# Altium schematic sheet Controller_Sheet.SchDoc
size A4; SheetNumber: 2; SheetTotal: 3
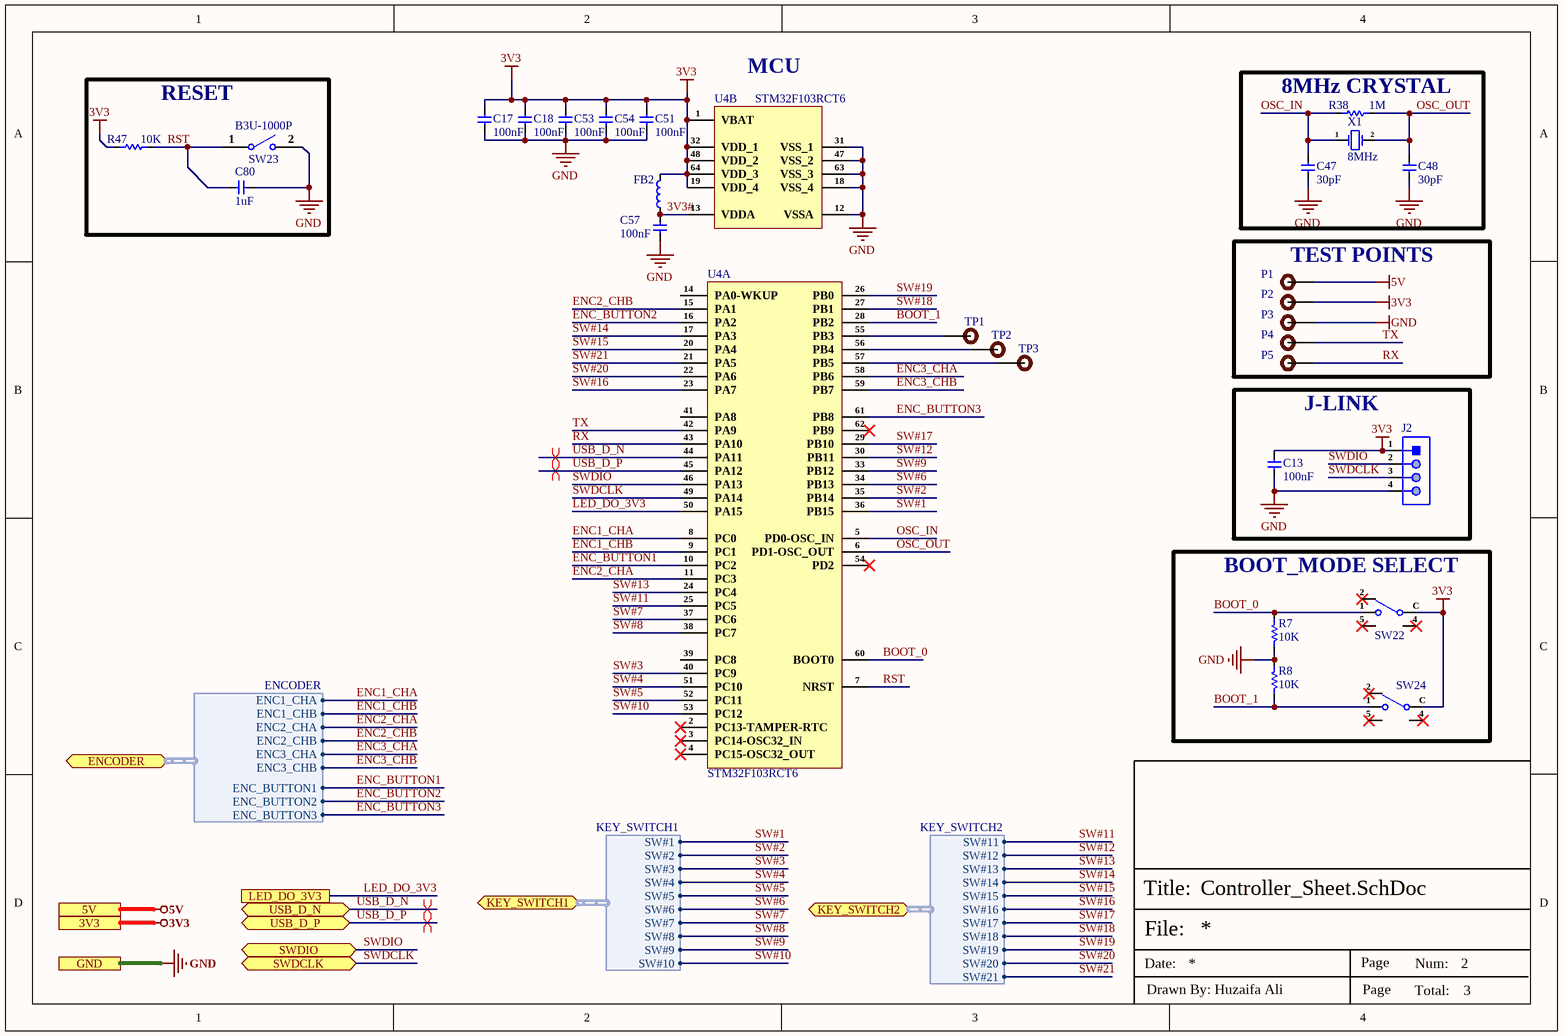
[diagram p0: Controller_Sheet.SchDoc]

## Parts
C13  100nF  [cap-0402]
C17  100nF  [cap-0402]
C18  100nF  [cap-0402]
C47  30pF  [Cap-0402]
C48  30pF  [Cap-0402]
C51  100nF  [cap-0402]
C53  100nF  [cap-0402]
C54  100nF  [cap-0402]
C57  100nF  [cap-0402]
C80  1uF  [Cap-0402]
FB2  MMZ2012R102ATD25  [Ind-0805]  (value not drawn)
J2  X6511WV-04H-C60D30  [HDR1X4_]  (value not drawn)
P1  TEST POINT  [Test-point]  (value not drawn)
P2  TEST POINT  [Test-point]  (value not drawn)
P3  TEST POINT  [Test-point]  (value not drawn)
P4  TEST POINT  [Test-point]  (value not drawn)
P5  TEST POINT  [Test-point]  (value not drawn)
R7  10K  [Res-0402]
R8  10K  [Res-0402]
R38  1M  [Res-0402]
R47  10K  [Res-0603]
SW22  MK-11C04-G013  [MK-11C04-G013]  (value not drawn)
SW23  B3U-1000P  [B3U-1000P]
SW24  MK-11C04-G013  [MK-11C04-G013]  (value not drawn)
TP1  TEST POINT 0.5mm Dia  [Test-point - 0.5mm]  (value not drawn)  (no BOM)
TP2  TEST POINT 0.5mm Dia  [Test-point - 0.5mm]  (value not drawn)  (no BOM)
TP3  TEST POINT 0.5mm Dia  [Test-point - 0.5mm]  (value not drawn)  (no BOM)
U4  STM32F103RCT6  [64-LQFP (10x10)]  (parts A,B of 2)
X1  8MHz  [0153G2-8.000F20DTNJL]

## Blocks framed on the sheet
RESET: C80 R47 SW23
8MHz CRYSTAL: C47 C48 R38 X1
TEST POINTS: P1-P5
J-LINK: C13 J2
BOOT_MODE SELECT: R7 R8 SW22 SW24

## Ports
3V3, 5V, ENCODER (bidir, harness ENCODER), GND, KEY_SWITCH1 (bidir, harness KEY_SWITCH1), KEY_SWITCH2 (bidir, harness KEY_SWITCH2), LED_DO_3V3, SWDCLK (bidir), SWDIO (bidir), USB_D_N (bidir), USB_D_P (bidir)

## Harnesses
KEY_SWITCH2: SW#11, SW#12, SW#13, SW#14, SW#15, SW#16, SW#17, SW#18, SW#19, SW#20, SW#21
KEY_SWITCH1: SW#1, SW#2, SW#3, SW#4, SW#5, SW#6, SW#7, SW#8, SW#9, SW#10
ENCODER: ENC1_CHA, ENC1_CHB, ENC2_CHA, ENC2_CHB, ENC3_CHA, ENC3_CHB, ENC_BUTTON1, ENC_BUTTON2, ENC_BUTTON3

## Nets
3V3: C13.2 C17.1 C18.1 C51.1 C53.1 C54.1 FB2.2 J2.1 P2.1 R47.1 SW22.C SW24.C U4.1(VBAT) U4.19(VDD_4) U4.32(VDD_1) U4.48(VDD_2) U4.64(VDD_3) ; port 3V3
5V: P1.1 ; port 5V
GND: C13.1 C17.2 C18.2 C47.1 C48.1 C51.2 C53.2 C54.2 C57.2 C80.2 J2.4 P3.1 R7.2 R8.1 SW23.2 U4.12(VSSA) U4.18(VSS_4) U4.31(VSS_1) U4.47(VSS_2) U4.63(VSS_3) ; port GND
3V3#: C57.1 FB2.1 U4.13(VDDA)
BOOT_0: R7.1 SW22.1 U4.60(BOOT0)
BOOT_1: R8.2 SW24.1 U4.28(PB2)
ENC1_CHA: U4.8(PC0) ; port ENCODER.ENC1_CHA
ENC1_CHB: U4.9(PC1) ; port ENCODER.ENC1_CHB
ENC2_CHA: U4.11(PC3) ; port ENCODER.ENC2_CHA
ENC2_CHB: U4.15(PA1) ; port ENCODER.ENC2_CHB
ENC3_CHA: U4.58(PB6) ; port ENCODER.ENC3_CHA
ENC3_CHB: U4.59(PB7) ; port ENCODER.ENC3_CHB
ENC_BUTTON1: U4.10(PC2) ; port ENCODER.ENC_BUTTON1
ENC_BUTTON2: U4.16(PA2) ; port ENCODER.ENC_BUTTON2
ENC_BUTTON3: U4.61(PB8) ; port ENCODER.ENC_BUTTON3
LED_DO_3V3: U4.50(PA15) ; port LED_DO_3V3
OSC_IN: C47.2 R38.1 U4.5(PD0-OSC_IN) X1.1(OSC1)
OSC_OUT: C48.2 R38.2 U4.6(PD1-OSC_OUT) X1.2(OSC2)
RST: C80.1 R47.2 SW23.1 U4.7(NRST)
RX: P5.1 U4.43(PA10)
SW#1: U4.36(PB15) ; port KEY_SWITCH1.SW#1
SW#2: U4.35(PB14) ; port KEY_SWITCH1.SW#2
SW#3: U4.40(PC9) ; port KEY_SWITCH1.SW#3
SW#4: U4.51(PC10) ; port KEY_SWITCH1.SW#4
SW#5: U4.52(PC11) ; port KEY_SWITCH1.SW#5
SW#6: U4.34(PB13) ; port KEY_SWITCH1.SW#6
SW#7: U4.37(PC6) ; port KEY_SWITCH1.SW#7
SW#8: U4.38(PC7) ; port KEY_SWITCH1.SW#8
SW#9: U4.33(PB12) ; port KEY_SWITCH1.SW#9
SW#10: U4.53(PC12) ; port KEY_SWITCH1.SW#10
SW#11: U4.25(PC5) ; port KEY_SWITCH2.SW#11
SW#12: U4.30(PB11) ; port KEY_SWITCH2.SW#12
SW#13: U4.24(PC4) ; port KEY_SWITCH2.SW#13
SW#14: U4.17(PA3) ; port KEY_SWITCH2.SW#14
SW#15: U4.20(PA4) ; port KEY_SWITCH2.SW#15
SW#16: U4.23(PA7) ; port KEY_SWITCH2.SW#16
SW#17: U4.29(PB10) ; port KEY_SWITCH2.SW#17
SW#18: U4.27(PB1) ; port KEY_SWITCH2.SW#18
SW#19: U4.26(PB0) ; port KEY_SWITCH2.SW#19
SW#20: U4.22(PA6) ; port KEY_SWITCH2.SW#20
SW#21: U4.21(PA5) ; port KEY_SWITCH2.SW#21
SWDCLK: J2.3 U4.49(PA14) ; port SWDCLK
SWDIO: J2.2 U4.46(PA13) ; port SWDIO
TX: P4.1 U4.42(PA9)
USB_D_N: U4.44(PA11) ; port USB_D_N
USB_D_P: U4.45(PA12) ; port USB_D_P
NetTP1_1: TP1.1 U4.55(PB3)
NetTP2_1: TP2.1 U4.56(PB4)
NetTP3_1: TP3.1 U4.57(PB5)

Not connected (* = marked no-connect by the designer): SW22 2* 4(MP)* 5(MP)*; SW24 2* 4(MP)* 5(MP)*; U4 2(PC13-TAMPER-RTC)* 3(PC14-OSC32_IN)* 4(PC15-OSC32_OUT)* 14(PA0-WKUP) 39(PC8) 41(PA8) 54(PD2)* 62(PB9)*

## Layout directives
differential pair; net class USB; differential pair class USB_Lines; rule Impedance Constraint [Min = 85.00    Max = 90.00    ]; rule Matched Net Lengths [Tolerance = 50mil]: USB_D_N, USB_D_P

## Notes on the sheet
- (near U4) MCU
- File:
- Title:
- Date:
- Page
- Num:
- Total:
- Drawn By: Huzaifa Ali

## Library data of the parts
C13 C17 C18 C51 C53 C54 C57 = C1005X7R1H104KT000F: CAP CER 0.1UF 50V X7R 0402; Manufacturer: TDK; Tolerance: 10%; Voltage: 25V; Item Type: Capacitor; Supplier 1: Avnet; Manufacturer Part Number: C1005X7R1H104KT000F; RoHS: No; Category: Ceramic Capacitors; Dielectric: X7R; Supplier Part Number 1: C1005X7R1H104KT000F; LCSC Part Number: C361198; ComponentLink1Description: LCSC; ComponentLink1URL: https://www.lcsc.com/product-detail/Multilayer-Ceramic-Capacitors-MLCC-SMD-SMT_TDK-C1005X7R1H104KT000F_C361198.html
C47 C48 = CC0402GRNPO9BN300: CAP CER 30PF 50V C0G/NPO 0402; Manufacturer: Yageo; Item Type: Capacitor; Tolerance: 2%; Dielectric: C0G; Supplier: Digikey; LCSC Part Number: C277479; Manufacturer Part Number: CC0402GRNPO9BN300; RoHS: Yes; Stock: 114930; Pricing: 1=0.1, 10=0.052, 50=0.0296, 100=0.023, 500=0.01728, 1000=0.01358, 2500=0.01235, 5000=0.01136 (USD); Mounting Technology: Surface Mount; Case/Package: 0402; Case Code (Imperial): 0402; Case Code (Metric): 1005; Weight: 2.3E-05oz; Min Operating Temperature: -55°C; Max Operating Temperature: 125°C; Value: 30pF; Voltage Rating (DC): 50V; Packaging: Tape and Reel; Termination: SMD/SMT; Voltage Rating: 50V; Series: CC; Length: 0.039inch; Width: 0.02inch; Thickness: 0.022inch; Halogen Free: 5694HalogenFree; Lead Free: 5697LeadFree; ComponentLink1URL: https://datasheet.ciiva.com/13263/upy-gp-np0-16v-to-50v-8-3714-13263350.pdf?src-supplier=Mouser; ComponentLink1Description: https://datasheet.ciiva.com/13263/upy-gp-np0-16v-to-50v-8-3714-13263350.pdf?src-supplier=Mouser
C80 = C1005X5R1V105K050BC: CAP CER 1UF 35V X5R 0402; Manufacturer: TDK; Item Type: Capacitors; Dielectric Material: Ceramic; Material: 4241ConductorMaterial; Tolerance: 10%; Supplier: Digikey; Supplier Part Number: 445-9073-1-ND; Manufacturer Part Number: C1005X5R1V105K050BC; RoHS: Yes; Stock: 682645; Pricing: 1=0.15, 10=0.087, 50=0.061, 100=0.0528, 500=0.03898, 1000=0.03468, 2500=0.03011, 5000=0.02735 (USD); Mounting Technology: Surface Mount; Case/Package: 0402; Case Code (Metric): 1005; Case Code (Imperial): 0402; Min Operating Temperature: -55°C; Max Operating Temperature: 85°C; Value: 1uF; Voltage Rating: 35V; Packaging: Tape and Reel; Dielectric: X5R; Series: C; Length: 1mm; Depth: 0.5mm; Radiation Hardening: No; Reach SVHC Compliant: No; Lead Free: Lead Free; RoHS Compliant: Yes; ComponentLink1URL: https://datasheet.ciiva.com/26834/getdatasheetpartid-750449-26834298.pdf?src-supplier=Verical; ComponentLink1Description: https://datasheet.ciiva.com/26834/getdatasheetpartid-750449-26834298.pdf?src-supplier=Verical; ComponentLink2URL: https://datasheet.ciiva.com/28451/1796654-28451087.pdf?src-supplier=Element14; ComponentLink2Description: https://datasheet.ciiva.com/28451/1796654-28451087.pdf?src-supplier=Element14; ComponentLink3URL: https://datasheet.ciiva.com/22719/1796654-22719533.pdf?src-supplier=Element14; ComponentLink3Description: https://datasheet.ciiva.com/22719/1796654-22719533.pdf?src-supplier=Element14
FB2 = MMZ2012R102ATD25: FERRITE BEAD 1K OHM 0805 1LN; Manufacturer: TDK; Number of Lines: 1; Max Current Rating: 500mA; DC Resistance (DCR): 300mR; Impedance: 1kR; Tolerance: 25%; Test Frequency: 100MHz; Supplier 1: Digi-Key; Manufacturer Part Number: MMZ2012R102ATD25; RoHS: Yes; Category: Ferrite Beads and Chips; Stock 1: 2942; Pricing 1: 1=0.11000, 10=0.09200, 25=0.08280, 50=0.06080, 100=0.05240, 250=0.04140, 500=0.03496, 1000=0.02944 (USD); Mount: Surface Mount; Case/Package: 0805; Case Code (Metric): 2012; Case Code (Imperial): 0805; Weight: 0.000194oz; Min Operating Temperature: -55°C; Max Operating Temperature: 125°C; Package Quantity: 4000; Packaging: Tape and Reel; Termination: SMD/SMT; Max DC Current: 500mA; Length: 0.079inch; Width: 0.049inch; Height: 0.041inch; Ratings: AEC-Q200; RoHS Compliant: Yes; ComponentLink1URL: http://www.mouser.com/ds/2/400/beads_automotive_signal_mmz_en-469244.pdf?src-supplier=Mouser; ComponentLink1Description: http://www.mouser.com/ds/2/400/beads_automotive_signal_mmz_en-469244.pdf?src-supplier=Mouser; ComponentLink2URL: https://product.tdk.com/info/en/catalog/datasheets/beads_automotive_signal_mmz2012_en.pdf?src-supplier=Digi-Key; ComponentLink2Description: https://product.tdk.com/info/en/catalog/datasheets/beads_automotive_signal_mmz2012_en.pdf?src-supplier=Digi-Key; Supplier Part Number 1: 445-MMZ2012R102ATD25CT-ND; LCSC Part Number: C307765; Item Type: Ferrite Bead
J2 = X6511WV-04H-C60D30: Gold 250V 3A Straight Square Pins 2.5mm 4P 260℃ 6mm -40℃~+105℃ 3mm 2.54mm Plugin Black Brass 1x4P Plugin,P=2.54mm Pin Headers ROHS; Manufacturer: XKB; Item Type: Male Header; ComponentLink1Description: LCSC; ComponentLink1URL: https://www.lcsc.com/product-detail/Pin-Headers_XKB-Connectivity-X6511WV-04H-C60D30_C706876.html; Manufacturer Part Number: X6511WV-04H-C60D30; Package: Plugin,P=2.54mm; LCSC Part Number: C706876
P1-P5 = TEST POINT: Test Point ON; Item Type: TEST POINT
R7 R8 = RC0402FR-0710KL: RES 10K OHM 1% 1/16W 0402; Manufacturer: Yageo; Resistance: 10kR; Voltage Rating (DC): 50V; Temperature Coefficient: 100ppm/°C; Power Rating: 62.5mW; Max Power Dissipation: 63mW; Item Type: Resistor; Supplier 1: Mouser; Manufacturer Part Number: RC0402FR-0710KL; RoHS: Yes; Category: Chip SMD Resistors; Stock 1: 18648329; Pricing 1: 1=0.10000, 10=0.01400, 50=0.01400, 100=0.00500, 1000=0.00300, 10000=0.00200 (USD); Case/Package: 0402; Number of Pins: 2; Case Code (Imperial): 0402; Case Code (Metric): 1005; Min Operating Temperature: -55°C; Max Operating Temperature: 155°C; Resistor Type: Thick Film; Tolerance: 1%; Packaging: Tape and Reel; Voltage Rating: 50V; Termination: SMD/SMT; Working Voltage: 50V; Number of Terminations: 2; Features: Moisture Resistant; Series: RC; Resistance Tolerance: 1%; Construction: Rectangular; Length: 1mm; Width: 0.5mm; Height: 0.32mm; Depth: 0.5mm; Lead Pitch: 0.2mm; REACH SVHC: No SVHC; Lead Free: Lead Free; RoHS Compliant: Yes; Military Standard: Not; ComponentLink1URL: https://datasheet.ciiva.com/7660/38568-7660787.pdf?src-supplier=Element14; ComponentLink1Description: https://datasheet.ciiva.com/7660/38568-7660787.pdf?src-supplier=Element14; ComponentLink2URL: https://datasheet.ciiva.com/7849/1686128-7849814.pdf?src-supplier=Element14; ComponentLink2Description: https://datasheet.ciiva.com/7849/1686128-7849814.pdf?src-supplier=Element14; ComponentLink3URL: https://datasheet.ciiva.com/7983/1018594-7983486.pdf?src-supplier=Element14; ComponentLink3Description: https://datasheet.ciiva.com/7983/1018594-7983486.pdf?src-supplier=Element14; ComponentLink4URL: https://datasheet.ciiva.com/22747/1018594-22747512.pdf?src-supplier=Element14; ComponentLink4Description: https://datasheet.ciiva.com/22747/1018594-22747512.pdf?src-supplier=Element14; ComponentLink5URL: https://datasheet.ciiva.com/12667/pyu-rc0402-51-rohs-l-6-r-12667067.pdf?src-supplier=Mouser; ComponentLink5Description: https://datasheet.ciiva.com/12667/pyu-rc0402-51-rohs-l-6-r-12667067.pdf?src-supplier=Mouser; ComponentLink6URL: https://datasheet.ciiva.com/7849/1784430-7849813.pdf?src-supplier=Element14; ComponentLink6Description: https://datasheet.ciiva.com/7849/1784430-7849813.pdf?src-supplier=Element14; ComponentLink7URL: https://datasheet.ciiva.com/7849/1784430-7849815.pdf?src-supplier=Element14; ComponentLink7Description: https://datasheet.ciiva.com/7849/1784430-7849815.pdf?src-supplier=Element14; Supplier Part Number 1: 603-RC0402FR-0710KL; LCSC Part Number: C60490
R38 = RC0402FR-071ML: RES 1M OHM 1% 1/16W 0402; Manufacturer: Yageo; Value: 1MR; Power Rating: 63mW; Voltage Rating: 50V; Temperature Coefficient: 100ppm/°C; Item Type: Resistor; Supplier: Digikey; Supplier Part Number: 311-1.00MLRCT-ND; Manufacturer Part Number: RC0402FR-071ML; RoHS: Yes; Category: Chip SMD Resistors; Stock: 6516; Pricing: 1=0.1, 10=0.015, 50=0.0088, 100=0.0073, 500=0.00488, 1000=0.00417, 5000=0.00297 (USD); Case/Package: 0402; Case Code (Imperial): 0402; Case Code (Metric): 1005; Min Operating Temperature: -55°C; Max Operating Temperature: 155°C; Resistor Type: Thick Film; Packaging: Tape and Reel; Tolerance: 1%; Termination: SMD/SMT; Features: Moisture Resistant; Series: RC; Max Power Dissipation: 63mW; Number of Terminations: 2; Resistance Tolerance: 1%; Construction: Rectangular; Technology: THICK FILM; Voltage Rating (AC): 50V; Length: 1mm; Height: 0.32mm; Depth: 0.5mm; RoHS Compliant: Yes; Military Standard: Not; Reach SVHC Compliant: Unknown; Lead Free: 5697LeadFree; ComponentLink1URL: https://datasheet.ciiva.com/11808/0900766b80c66297-11808125.pdf?src-supplier=Rs; ComponentLink1Description: https://datasheet.ciiva.com/11808/0900766b80c66297-11808125.pdf?src-supplier=Rs; ComponentLink2URL: https://datasheet.ciiva.com/46394/1018594-46394951.pdf?src-supplier=Element14; ComponentLink2Description: https://datasheet.ciiva.com/46394/1018594-46394951.pdf?src-supplier=Element14; ComponentLink3URL: https://datasheet.ciiva.com/7849/1018594-7849883.pdf?src-supplier=Element14; ComponentLink3Description: https://datasheet.ciiva.com/7849/1018594-7849883.pdf?src-supplier=Element14; ComponentLink4URL: https://datasheet.ciiva.com/7849/1018594-7849882.pdf?src-supplier=Element14; ComponentLink4Description: https://datasheet.ciiva.com/7849/1018594-7849882.pdf?src-supplier=Element14; ComponentLink5URL: https://datasheet.ciiva.com/16741/pyu-rc0402-51-rohs-l-6-r-16741081.pdf?src-supplier=Future+Electronics; ComponentLink5Description: https://datasheet.ciiva.com/16741/pyu-rc0402-51-rohs-l-6-r-16741081.pdf?src-supplier=Future+Electronics; LCSC Part Number: C138033
R47 = RC0603FR-0710KL: RES SMD 10K Ohm 1% 1/10W 0603; Manufacturer: Yageo; Resistance: 10kR; Temperature Coefficient: 100ppm/°C; Voltage Rating (DC): 50V; Power Rating: 100mW; Voltage Rating: 75V; Item Type: Resistor; Supplier 1: Digi-Key; Manufacturer Part Number: RC0603FR-0710KL; RoHS: Yes; Category: Chip SMD Resistors; Stock 1: 25249139; Pricing 1: 1=0.10000, 10=0.02400, 100=0.00970, 1000=0.00436, 2500=0.00378 (USD); Case/Package: 0603; Number of Pins: 2; Case Code (Imperial): 0603; Case Code (Metric): 1608; Weight: 7.1E-05oz; Size Code: 0603; Min Operating Temperature: -55°C; Max Operating Temperature: 155°C; Tolerance: 1%; Resistor Type: Thick Film; Packaging: Tape and Reel; Termination: SMD/SMT; Features: Moisture Resistant; Series: RC; Max Power Dissipation: 100mW; Number of Terminations: 2; Resistance Tolerance: 1%; Construction: Rectangular; Length: 1.6mm; Width: 0.8mm; Height: 0.45mm; Depth: 0.8mm; Lead Pitch: 0.3mm; REACH SVHC: Unknown; Lead Free: Lead Free; Military Standard: Not; RoHS Compliant: Yes; ComponentLink1URL: https://datasheet.ciiva.com/7660/38590-7660789.pdf?src-supplier=Element14; ComponentLink1Description: https://datasheet.ciiva.com/7660/38590-7660789.pdf?src-supplier=Element14; ComponentLink2URL: https://datasheet.ciiva.com/7983/443971-7983596.pdf?src-supplier=Element14; ComponentLink2Description: https://datasheet.ciiva.com/7983/443971-7983596.pdf?src-supplier=Element14; ComponentLink3URL: https://datasheet.ciiva.com/22747/443971-22747519.pdf?src-supplier=Element14; ComponentLink3Description: https://datasheet.ciiva.com/22747/443971-22747519.pdf?src-supplier=Element14; ComponentLink4URL: https://datasheet.ciiva.com/46440/1868787-46440891.pdf?src-supplier=Element14; ComponentLink4Description: https://datasheet.ciiva.com/46440/1868787-46440891.pdf?src-supplier=Element14; ComponentLink5URL: https://datasheet.ciiva.com/7746/1738695-7746239.pdf?src-supplier=Element14; ComponentLink5Description: https://datasheet.ciiva.com/7746/1738695-7746239.pdf?src-supplier=Element14; ComponentLink6URL: https://datasheet.ciiva.com/15189/getdatasheetpartid-409289-15189591.pdf?src-supplier=Verical; ComponentLink6Description: https://datasheet.ciiva.com/15189/getdatasheetpartid-409289-15189591.pdf?src-supplier=Verical; Supplier Part Number 1: 311-10.0KHRCT-ND; LCSC Part Number: C98220
SW22 SW24 = MK-11C04-G013: Surface Mount 1A SPDT 6V Black 10000次 SMD Slide Switches ROHS; Manufacturer: G-Switch; Manufacturer Part Number: MK-11C04-G013; Package: SMD; LCSC Part Number: C778185; Item Type: Slide Switche; ComponentLink1Description: LCSC; ComponentLink1URL: https://www.lcsc.com/product-detail/Slide-Switches_G-Switch-MK-11C04-G013_C778185.html
SW23 = B3U-1000P: SWITCH TACTILE SPST-NO 0.05A 12V; Manufacturer: Omron; Mechanical Life: 200000Cycles; Operating Force: 1.5N; Throw Configuration: SPST; Current Rating: 50mA; Contact Resistance: 100mR; Illumination Type: Non-Illuminated,Illuminated; Switch Travel: 0.15mm; Switch Function: Off-Mom; Actuator Type: Standard; Actuator Length: 0.4mm; Ratings: Dust Proof,IP40; ComponentLink1URL: http://www.farnell.com/datasheets/60838.pdf?src-supplier=Farnell; ComponentLink1Description: http://www.farnell.com/datasheets/60838.pdf?src-supplier=Farnell; ComponentLink2URL: http://www.farnell.com/datasheets/60838.pdf?src-supplier=Element14; ComponentLink2Description: http://www.farnell.com/datasheets/60838.pdf?src-supplier=Element14; ComponentLink3URL: https://omronfs.omron.com/en_US/ecb/products/pdf/en-b3u.pdf?src-supplier=Digi-Key; ComponentLink3Description: https://omronfs.omron.com/en_US/ecb/products/pdf/en-b3u.pdf?src-supplier=Digi-Key; ComponentLink4URL: http://www.omron.com/ecb/products/pdf/en-b3u.pdf?src-supplier=Digi-Key; ComponentLink4Description: http://www.omron.com/ecb/products/pdf/en-b3u.pdf?src-supplier=Digi-Key; ComponentLink5URL: https://www.distrelec.biz/Web/Downloads/he/et/B3U_eng_datasheet.pdf?mime=application%2Fpdf&src-supplier=Distrelec; ComponentLink5Description: https://www.distrelec.biz/Web/Downloads/he/et/B3U_eng_datasheet.pdf?mime=application%2Fpdf&src-supplier=Distrelec; ComponentLink6URL: http://www.onlinecomponents.com/productFiles/mf-OM/en-b3u.pdf?src-supplier=Onlinecomponents.com; ComponentLink6Description: http://www.onlinecomponents.com/productFiles/mf-OM/en-b3u.pdf?src-supplier=Onlinecomponents.com; Supplier 1: Digi-Key; Manufacturer Part Number: B3U-1000P; Stock 1: 116454; Pricing 1: 1=1, 10=0.961, 25=0.9064, 50=0.7976, 100=0.7251, 250=0.68888, 500=0.67074, 1000=0.52571 (USD); Mount: Surface Mount; Weight: 0.000776oz; Contact Material: Silver; Min Operating Temperature: -25°C; Max Operating Temperature: 70°C; Packaging: Tape and Reel; Voltage Rating (DC): 12V; Package Quantity: 1; Max Current Rating: 50mA; Termination: SMD/SMT; Orientation: Straight; Max Voltage Rating (DC): 12V; Electrical Life: 200000Cycles; Insulation Resistance: 100MR; Contact Current Rating: 50mA; Length: 4mm; Height: 1.2mm; Depth: 2.5mm; Width: 3mm; REACH SVHC: Unknown; Lead Free: Lead Free; ComponentLink7URL: https://www.verical.com/server-webapp/html/getDatasheet?partID=552554&src-supplier=Verical; ComponentLink7Description: https://www.verical.com/server-webapp/html/getDatasheet?partID=552554&src-supplier=Verical; ComponentLink8URL: http://www.farnell.com/datasheets/1685550.pdf?src-supplier=Element14; ComponentLink8Description: http://www.farnell.com/datasheets/1685550.pdf?src-supplier=Element14; ComponentLink9URL: http://www.farnell.com/datasheets/2610940.pdf?src-supplier=Farnell; ComponentLink9Description: http://www.farnell.com/datasheets/2610940.pdf?src-supplier=Farnell; ComponentLink10URL: https://www.alliedelec.com/m/d/4c8a9ef82804fc3c241a13c1e298fd73.pdf?src-supplier=Allied+Electronics; ComponentLink10Description: https://www.alliedelec.com/m/d/4c8a9ef82804fc3c241a13c1e298fd73.pdf?src-supplier=Allied+Electronics; Supplier Part Number 1: SW1020DKR-ND; LCSC Part Number: C231329; Item Type: Switch
TP1-TP3 = TEST POINT 0.5mm Dia: Test Point ON; Item Type: Test Point; Manufacturer Part Number: TEST POINT 0.5mm Dia
U4 = STM32F103RCT6: IC MCU 32BIT 256KB FLASH 64LQFP; Manufacturer: STMicroelectronics; Interface: I2C,SPI,USB,CAN,USART; RAM Size: 48KB; Max Supply Voltage: 3.6V; Number of I/Os: 51; Number of Timers/Counters: 8; Min Supply Voltage: 2V; Data Bus Width: 32b; Clock Frequency: 72MHz; Core Architecture: ARM; Number of ADC Channels: 16; Supplier 1: Mouser; Manufacturer Part Number: STM32F103RCT6; RoHS: Yes; Category: Microcontrollers; Stock 1: 44788; Pricing 1: 1=9.74000, 10=8.79000, 50=8.38000, 100=7.28000, 1000=5.58000, 10000=5.58000 (USD); Case/Package: LQFP; Pins: 64; Weight: 0.012088oz; Min Operating Temperature: -40°C; Max Operating Temperature: 85°C; Package Quantity: 960; Packaging: Tray; Memory Format: FLASH; Memory Size: 256KB; Series: STM32F103RC; Length: 10mm; Width: 10mm; Height: 1.4mm; Lead Free: Lead Free; RoHS Compliant: Yes; ComponentLink1URL: https://datasheet.ciiva.com/4845/cd00191185-4845648.pdf?src-supplier=Mouser; ComponentLink1Description: https://datasheet.ciiva.com/4845/cd00191185-4845648.pdf?src-supplier=Mouser; ComponentLink2URL: https://datasheet.ciiva.com/8054/1831497-8054949.pdf?src-supplier=Element14; ComponentLink2Description: https://datasheet.ciiva.com/8054/1831497-8054949.pdf?src-supplier=Element14; ComponentLink3URL: https://datasheet.ciiva.com/5752/cd00191185-5752853.pdf?src-supplier=Farnell; ComponentLink3Description: https://datasheet.ciiva.com/5752/cd00191185-5752853.pdf?src-supplier=Farnell; ComponentLink4URL: https://datasheet.ciiva.com/9224/cd00191185-9224408.pdf?src-supplier=Avnet; ComponentLink4Description: https://datasheet.ciiva.com/9224/cd00191185-9224408.pdf?src-supplier=Avnet; ComponentLink5URL: https://datasheet.ciiva.com/16382/cd00191185-16382444.pdf?src-supplier=Future+Electronics; ComponentLink5Description: https://datasheet.ciiva.com/16382/cd00191185-16382444.pdf?src-supplier=Future+Electronics; Supplier Part Number 1: 511-STM32F103RCT6; LCSC Part Number: C8323; Item Type: IC
X1 = 0153G2-8.000F20DTNJL: 8MHz Surface Mount Crystal 20pF ±10ppm ±30ppm SMD5032 Crystals ROHS; Manufacturer: HCI; Manufacturer Part Number: 0153G2-8.000F20DTNJL; Package: SMD5032; LCSC Part Number: C19270155; Item Type: Crystal; ComponentLink1Description: LCSC; ComponentLink1URL: https://www.lcsc.com/product-detail/Crystals_HCI-0153G2-8-000F20DTNJL_C19270155.html